# Altium schematic sheet Power_Section.SchDoc: =Projectname
size A4; SheetNumber: 4; SheetTotal: 4
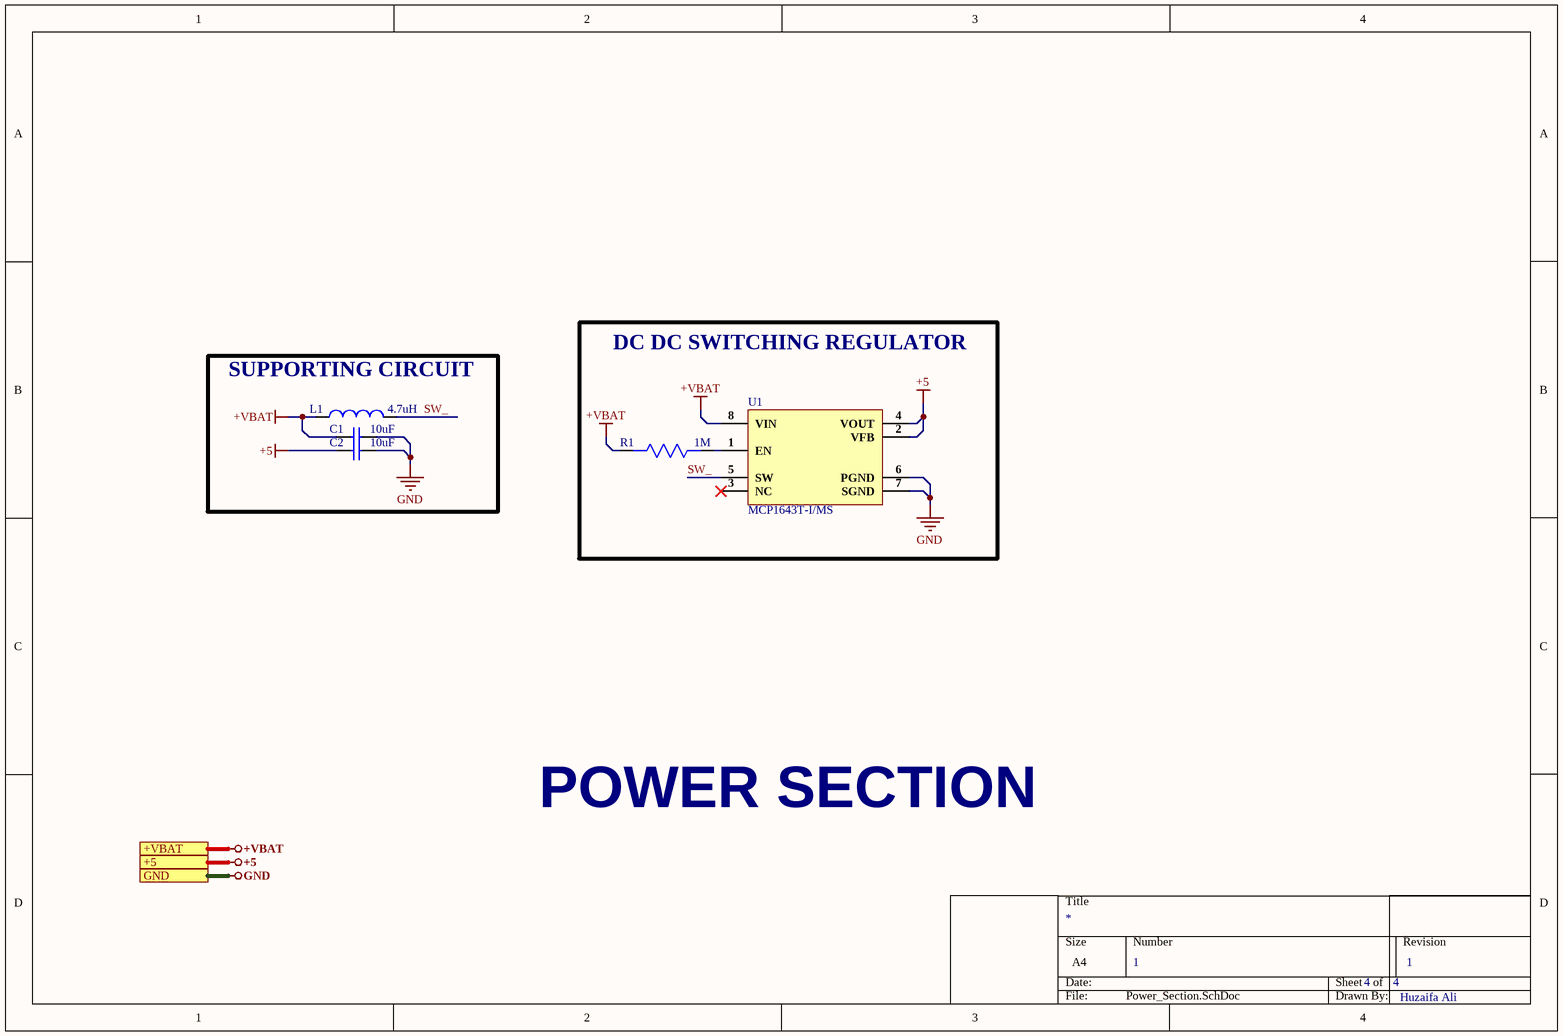
[diagram p0: Power_Section.SchDoc]

## Parts
C1  10uF  [Cap0805]
C2  10uF  [Cap0805]
L1  4.7uH  [SRN5020-4R7M]
R1  1M  [Res0402]
U1  MCP1643T-I/MS  [8-MSOP]

## Blocks framed on the sheet
DC DC SWITCHING REGULATOR: R1 U1
SUPPORTING CIRCUIT: C1 C2 L1

## Ports
+5, +VBAT, GND

## Nets
+5: C2.1 U1.2(VFB) U1.4(VOUT) ; port +5
+VBAT: C1.1 L1.1 R1.2 U1.8(VIN) ; port +VBAT
GND: C1.2 C2.2 U1.6(PGND) U1.7(SGND) ; port GND
SW_: L1.2 U1.5(SW)
NetR1_1: R1.1 U1.1(EN)

Not connected (* = marked no-connect by the designer): U1 3(NC)*

## Notes on the sheet
- POWER SECTION
- 1
- Huzaifa Ali

## Library data of the parts
C1 C2 = TMK212BBJ106KGHT: CAP CER 10UF 25V X5R 0805; Manufacturer: Taiyo Yuden; Tolerance: 10%; Supplier 1: Newark; Manufacturer Part Number: TMK212BBJ106KGHT; RoHS: Yes; Category: Ceramic Capacitors; Stock 1: 26354; Pricing 1: 1=0.06100, 25=0.06100, 50=0.06100, 100=0.06100, 250=0.06100, 500=0.05600 (USD); Mount: Surface Mount; Case/Package: 0805; Case Code (Metric): 2012; Case Code (Imperial): 0805; Weight: 0.000194oz; Min Operating Temperature: -55°C; Max Operating Temperature: 85°C; Capacitance: 10uF; Packaging: Tape and Reel; Voltage Rating: 25V; Dielectric: X5R; Termination: SMD/SMT; Voltage Rating (DC): 25V; Package Quantity: 3000; Length: 0.079inch; Width: 0.049inch; Height: 1.25mm; Thickness: 0.053inch; Ratings: AEC-Q200; RoHS Compliant: Yes; ComponentLink1URL: http://www.mouser.com/ds/2/396/mlcc11_hq_e-541564.pdf?src-supplier=Mouser; ComponentLink1Description: http://www.mouser.com/ds/2/396/mlcc11_hq_e-541564.pdf?src-supplier=Mouser; ComponentLink2URL: https://www.yuden.co.jp/productdata/catalog/mlcc_all_hq_e.pdf?src-supplier=Digi-Key; ComponentLink2Description: https://www.yuden.co.jp/productdata/catalog/mlcc_all_hq_e.pdf?src-supplier=Digi-Key; ComponentLink3URL: http://ds.yuden.co.jp/TYCOMPAS/ut/detail.do?productNo=TMK212BBJ106KGHT&fileName=TMK212BBJ106KGHT_SS&mode=specSheetDownload&src-supplier=Digi-Key; ComponentLink3Description: http://ds.yuden.co.jp/TYCOMPAS/ut/detail.do?productNo=TMK212BBJ106KGHT&fileName=TMK212BBJ106KGHT_SS&mode=specSheetDownload&src-supplier=Digi-Key; ComponentLink4URL: http://ds.yuden.co.jp/TYCOMPAS/ut/detail.do?productNo=TMK212BBJ106KGHT&dataUnit=M&src-supplier=Avnet; ComponentLink4Description: http://ds.yuden.co.jp/TYCOMPAS/ut/detail.do?productNo=TMK212BBJ106KGHT&dataUnit=M&src-supplier=Avnet; Supplier Part Number 1: 95Y2170
L1 = SRN5020-4R7M: FIXED IND 4.7UH 2A 72 MOHM SMD; Manufacturer: Bourns; Material: Steel; Core Material: Ferrite; DC Resistance (DCR): 72mR; Self Resonant Frequency: 30MHz; Test Frequency: 100kHz; Tolerance: 20%; Shielding: Shielded; Supplier 1: Mouser; Manufacturer Part Number: SRN5020-4R7M; RoHS: Yes; Category: Fixed Inductors; Stock 1: 12; Pricing 1: 1=0.55000, 10=0.38000, 50=0.38000, 100=0.32900, 250=0.30900, 500=0.27900, 1000=0.23400, 2000=0.22700, 10000=0.22700 (USD); Mount: Surface Mount; Case/Package: 2020; Number of Pins: 2; Min Operating Temperature: -25°C; Max Operating Temperature: 120°C; Resistor Type: Wirewound; Max DC Current: 2A; Termination: SMD/SMT; DC Current: 2A; RMS Current (Irms): 2A; Package Quantity: 2000; Current Rating: 2A; Saturation Current: 2A; Packaging: Cut Tape; Inductance Tolerance: 20%; Inductance: 4.7uH; Length: 5mm; Width: 5mm; Height: 2mm; Height - Seated (Max): 0.079inch; Depth: 5.2mm; REACH SVHC: No SVHC; Military Standard: Not; ComponentLink1URL: https://datasheet.ciiva.com/46451/1684090-46451208.pdf?src-supplier=Element14; ComponentLink1Description: https://datasheet.ciiva.com/46451/1684090-46451208.pdf?src-supplier=Element14; ComponentLink2URL: https://datasheet.ciiva.com/17111/70255680-17111900.pdf?src-supplier=Allied+Electronics; ComponentLink2Description: https://datasheet.ciiva.com/17111/70255680-17111900.pdf?src-supplier=Allied+Electronics; ComponentLink3URL: https://datasheet.ciiva.com/6689/srn5020-6689167.pdf?src-supplier=Digi-Key; ComponentLink3Description: https://datasheet.ciiva.com/6689/srn5020-6689167.pdf?src-supplier=Digi-Key; ComponentLink4URL: https://datasheet.ciiva.com/13168/srn5020-13168591.pdf?src-supplier=Mouser; ComponentLink4Description: https://datasheet.ciiva.com/13168/srn5020-13168591.pdf?src-supplier=Mouser; ComponentLink5URL: https://datasheet.ciiva.com/22717/1684090-22717782.pdf?src-supplier=Element14; ComponentLink5Description: https://datasheet.ciiva.com/22717/1684090-22717782.pdf?src-supplier=Element14; Supplier Part Number 1: 652-SRN5020-4R7M
R1 = AF0402FR-071ML: RES SMD 1M OHM 1% 1/16W 0402; Manufacturer: Yageo; Resistance: 1MR; Max Power Dissipation: 63mW; Temperature Coefficient: 100ppm/°C; Supplier 1: Mouser; Manufacturer Part Number: AF0402FR-071ML; RoHS: Yes; Category: Chip SMD Resistors; Stock 1: 35543; Pricing 1: 1=0.12000, 10=0.06300, 50=0.06300, 100=0.02600, 1000=0.01200, 10000=0.00700 (USD); Case/Package: 0402; Min Operating Temperature: -55°C; Max Operating Temperature: 155°C; Packaging: Tape and Reel; Resistor Type: Thick Film; Number of Terminations: 2; Tolerance: 1%; Features: Moisture Resistant,Anti-Sulfur; Length: 0.039inch; Width: 0.02inch; Height: 0.015inch; RoHS Compliant: Yes; ComponentLink1URL: http://www.yageo.com/documents/recent/PYu-AF_51_RoHS_L_5.pdf?src-supplier=Digi-Key; ComponentLink1Description: http://www.yageo.com/documents/recent/PYu-AF_51_RoHS_L_5.pdf?src-supplier=Digi-Key; Supplier Part Number 1: 603-AF0402FR-071ML
U1 = MCP1643T-I/MS: IC LED DRV RGLTR PWM 550MA 8MSOP; Manufacturer: Microchip; Number of Outputs: 1; Frequency: 1MHz; Max Supply Voltage: 5V; Topology: Boost; Supplier 1: Mouser; Manufacturer Part Number: MCP1643T-I/MS; RoHS: Yes; Category: LED Drivers; Stock 1: 22; Pricing 1: 1=1.33000, 10=1.33000, 50=1.12000, 100=1.02000, 1000=1.02000, 10000=1.02000 (USD); Mount: Surface Mount; Case/Package: MSOP; Weight: 0.004938oz; Min Operating Temperature: -40°C; Max Operating Temperature: 85°C; Packaging: Tape and Reel; Package Quantity: 2500; Output Current per Channel: 550mA; Output Current: 550mA; Output Voltage: 5V; Switching Frequency: 1MHz; Dimming: PWM; RoHS Compliant: Yes; ComponentLink1URL: http://www.mouser.com/ds/2/268/20005208A-708734.pdf?src-supplier=Mouser; ComponentLink1Description: http://www.mouser.com/ds/2/268/20005208A-708734.pdf?src-supplier=Mouser; ComponentLink2URL: http://www.microchip.com/mymicrochip/filehandler.aspx?ddocname=en565730&src-supplier=Digi-Key; ComponentLink2Description: http://www.microchip.com/mymicrochip/filehandler.aspx?ddocname=en565730&src-supplier=Digi-Key; Supplier Part Number 1: 579-MCP1643T-I/MS